# Altium schematic sheet Power.SchDoc
size A4; SheetNumber: 5; SheetTotal: 9
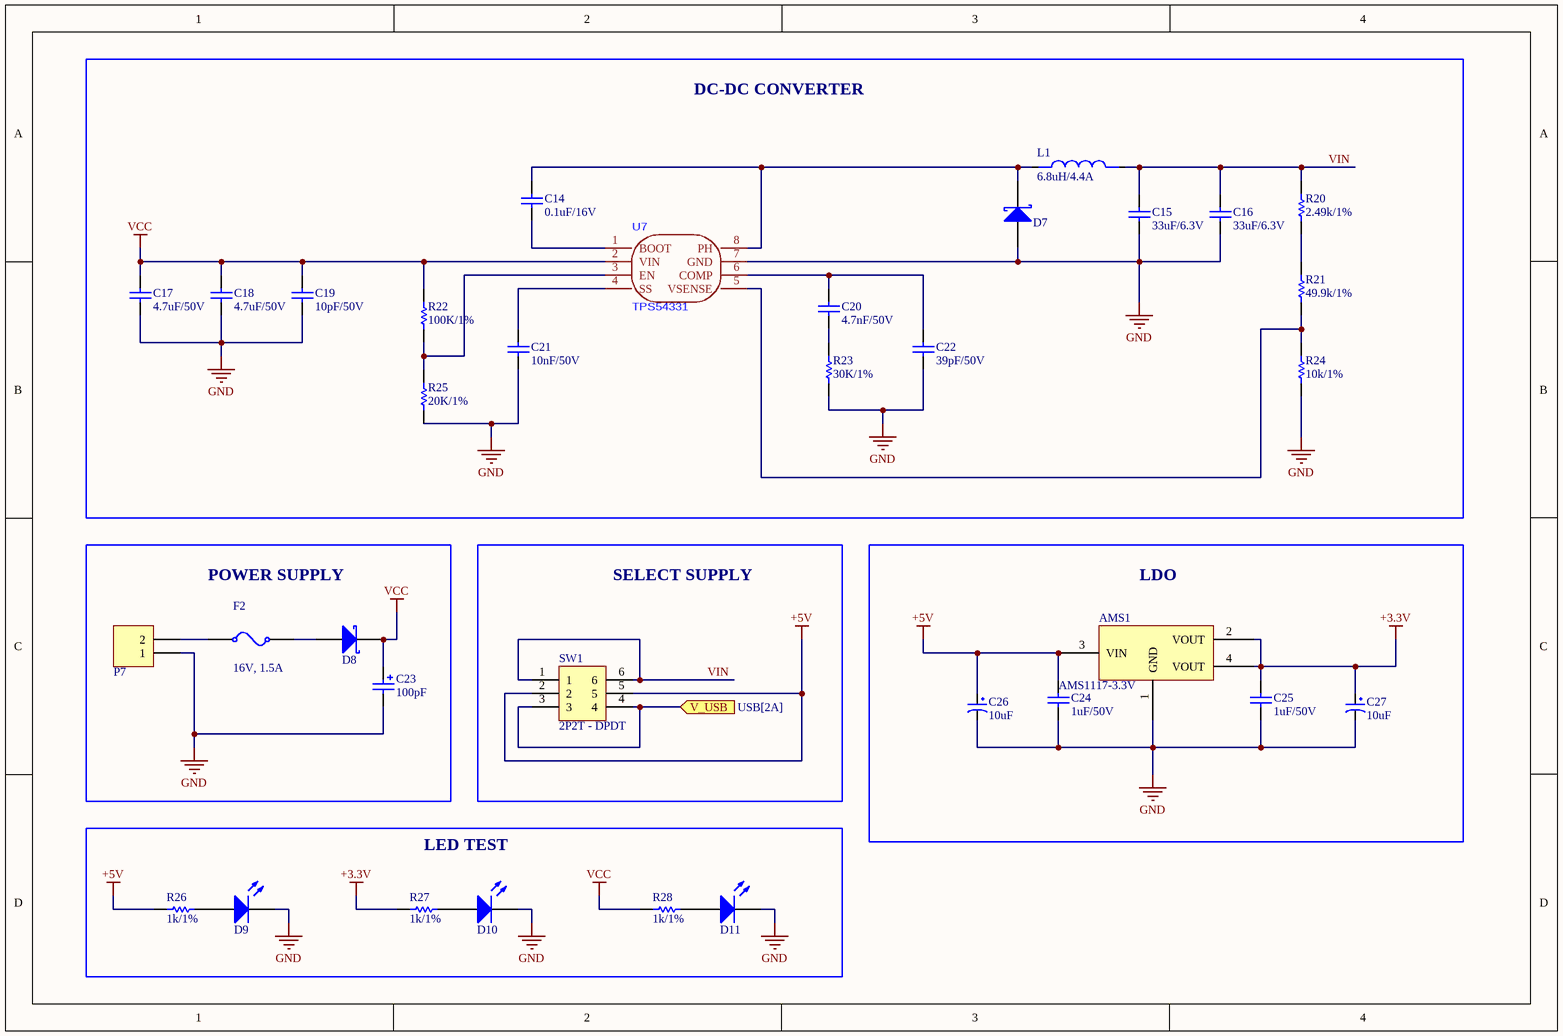
[diagram p0: Power.SchDoc]

## Parts
AMS1  AMS1117-3.3V  [SOT223]
C14  value 0.1uF/16V  [CAP-SM-0805]  (hidden comment: Cap Non-Pol SMD)
C15  value 33uF/6.3V  [CAP-SM-0805]  (hidden comment: Cap Non-Pol SMD)
C16  value 33uF/6.3V  [CAP-SM-0805]  (hidden comment: Cap Non-Pol SMD)
C17  value 4.7uF/50V  [CAP-SM-0805]  (hidden comment: Cap Non-Pol SMD)
C18  value 4.7uF/50V  [CAP-SM-0805]  (hidden comment: Cap Non-Pol SMD)
C19  value 10pF/50V  [CAP-SM-0805]  (hidden comment: Cap Non-Pol SMD)
C20  value 4.7nF/50V  [CAP-SM-0805]  (hidden comment: Cap Non-Pol SMD)
C21  value 10nF/50V  [CAP-SM-0805]  (hidden comment: Cap Non-Pol SMD)
C22  value 39pF/50V  [CAP-SM-0805]  (hidden comment: Cap Non-Pol SMD)
C23  value 100pF  [CP1/2]  (hidden comment: Cap Pol)
C24  value 1uF/50V  [CAP-SM-0805]  (hidden comment: Cap Non-Pol SMD)
C25  value 1uF/50V  [CAP-SM-0805]  (hidden comment: Cap Non-Pol SMD)
C26  10uF  [tu hoa 4mm]
C27  10uF  [tu hoa 4mm]
D7  D Schottky  [SS34]  (value not drawn)
D8  D Schottky  [SS34]  (value not drawn)
D9  LED SMD  [LED_0805_Blue]  (value not drawn)
D10  LED SMD  [LED_0805_Blue]  (value not drawn)
D11  LED SMD  [LED_0805_Blue]  (value not drawn)
F2  16V, 1.5A  [Fuse_SMD_1812]
L1  6.8uH/4.4A  [CUON CAM SMD 0530]
P7  Header 2  [JP2]  (value not drawn)
R20  value 2.49k/1%  [RES-SM-0805]  (hidden comment: RESISTOR SMD)
R21  value 49.9k/1%  [RES-SM-0805]  (hidden comment: RESISTOR SMD)
R22  value 100K/1%  [RES-SM-0805]  (hidden comment: RESISTOR SMD)
R23  value 30K/1%  [RES-SM-0805]  (hidden comment: RESISTOR SMD)
R24  value 10k/1%  [RES-SM-0805]  (hidden comment: RESISTOR SMD)
R25  value 20K/1%  [RES-SM-0805]  (hidden comment: RESISTOR SMD)
R26  value 1k/1%  [RES-SM-0805]  (hidden comment: RESISTOR SMD)
R27  value 1k/1%  [RES-SM-0805]  (hidden comment: RESISTOR SMD)
R28  value 1k/1%  [RES-SM-0805]  (hidden comment: RESISTOR SMD)
SW1  2P2T - DPDT  [SW_2P2T-DPDT_SMD]
U7  TPS54331  [SO-8 TSP5430D]

## Blocks framed on the sheet
DC-DC CONVERTER: C14-C22 D7 L1 R20-R25 U7
POWER SUPPLY: C23 D8 F2 P7
SELECT SUPPLY: SW1
LDO: AMS1 C24-C27
LED TEST: D9-D11 R26-R28

## Ports
V_USB (in, see USB[2A])

## Nets
+3.3V: AMS1.2(VOUT) AMS1.4(VOUT) C25.2 C27.1 R27.1
+5V: AMS1.3(VIN) C24.2 C26.1 R26.1 SW1.2 SW1.5
GND: AMS1.1(GND) C15.2 C16.2 C17.1 C18.1 C19.1 C21.1 C22.2 C23.2 C24.1 C25.1 C26.2 C27.2 D7.1(A) D9.2(K) D10.2(K) D11.2(K) P7.1 R23.2 R24.2 R25.2 U7.7(GND)
VCC: C17.2 C18.2 C19.2 C23.1 D8.2(K) R22.1 R28.1 U7.2(VIN)
V_USB: SW1.3 SW1.4 ; port V_USB
VIN: C15.1 C16.1 L1.2 R20.1 SW1.1 SW1.6
NetC14_1: C14.1 U7.1(BOOT)
NetC14_2: C14.2 D7.2(K) L1.1 U7.8(PH)
NetC20_1: C20.1 C22.1 U7.6(COMP)
NetC20_2: C20.2 R23.1
NetC21_2: C21.2 U7.4(SS)
NetD8_1: D8.1(A) F2.1
NetD9_1: D9.1(A) R26.2
NetD10_1: D10.1(A) R27.2
NetD11_1: D11.1(A) R28.2
NetF2_0: F2.0 P7.2
NetR20_2: R20.2 R21.1
NetR21_2: R21.2 R24.1 U7.5(VSENSE)
NetR22_2: R22.2 R25.1 U7.3(EN)

## Library data of the parts
AMS1 = AMS1117 SMD: Dán; Value: AMS1117-3.3V SOT223; Don_Vi: Con; Ma_Hang: MH000596; Ghi_Chu: *; Kieu_Chan: *; Chung_Loai: Dán
C14-C22 C24 C25 = Cap Non-Pol SMD: Capacitor
C23 = Cap Pol: Polarized Capacitor (Radial)
C26 C27 = Tu Hoa 10uF 25V 4x7: Cắm; So_Chan: 2; Ten_Linh_Kien: Tụ Hóa 10uF 25V 4x7MM; Don_Vi: Con; Ma_Hang: MH001349; Chung_Loai: Cắm; Kieu_Chan: *
D7 D8 = D Schottky: Schottky Diode; Published: 8-Jun-2000; LatestRevisionDate: 17-Jul-2002; LatestRevisionNote: Re-released for DXP Platform.; PackageReference: SMB; Publisher: Altium Limited; PackageDescription: DO-214-AA/SMB; 2 C-Bend Leads; Body 5.3 x 3.6 mm, inc. leads (LxW); Code_JEDEC: DO-214-AA
D9-D11 = LED SMD: LED
F2 = 061812150024: Resettable Fuse, Size 1812, 24V, 1.5A; Manufacturer: Littelfuse; Threshold Current: 20A; Trip Current: 3A; Threshold Voltage: 24V; Hold Current: 1.5A; Size: 1812; Mounting Technology: SMT/SMD; ComponentLink1Description: Datasheet link; ComponentLink1URL: https://www.littelfuse.com/~/media/electronics/product_specifications/resettable_ptcs/littelfuse_ptc_minismdc300f_2_product_specification.pdf.pdf; ComponentLink2Description: Supplier 1 URL; ComponentLink2URL: https://www.mouser.vn/ProductDetail/Littelfuse/MINISMDC150F-24-2?qs=F6FIpiMdEVZ%2Fp37J%2FDHAxA%3D%3D; ComponentLink3Description: Supplier 2 URL; ComponentLink3URL: https://www.digikey.com/en/products/detail/littelfuse-inc/MINISMDC150F-24-2/1113513?s=N4IgTCBcDaILIEkByCDKcAiBhAjAVgAYAxAejABYBaCAXQF8g; ComponentLink4Description: Supplier 3 URL; ComponentLink4URL: https://www.thegioiic.com/cau-chi-tu-phuc-hoi-1812-24v-1-5a; Supplier 1 Name: Mouser; Supplier 1 SN: 650-MINISMDC150F/24; Supplier 1 URL: https://www.mouser.vn/ProductDetail/Littelfuse/MINISMDC150F-24-2?qs=F6FIpiMdEVZ%2Fp37J%2FDHAxA%3D%3D; Supplier 2 Name: Digi-Key; Supplier 2 SN: MINISMDC150F24-2TR-ND; Supplier 2 URL: https://www.mouser.vn/ProductDetail/Littelfuse/MINISMDC150F-24-2?qs=F6FIpiMdEVZ%2Fp37J%2FDHAxA%3D%3D; Supplier 3 Name: thegioiic; Supplier 3 SN: N/A; Supplier 3 URL: https://www.thegioiic.com/cau-chi-tu-phuc-hoi-1812-24v-1-5a; Value: 24V, 1.5A
L1 = Cuon Cam SMD 0530: SMD 0530; MP: FDV0530-H-1R5M=P3; Package: None; Price: None; Value: *; Availability: Unavailable
P7 = Header 2: Header, 2-Pin; LatestRevisionDate: 17-Jul-2002; LatestRevisionNote: Re-released for DXP Platform.; Publisher: Altium Limited
R20-R28 = RESISTOR SMD: Resistor
SW1 = SW2_0.3A-2P2T- DPDT-SMD: PCB Mountable Slide Switch. Double Pole, Double Throw = DPDT; Manufacturer: NA; Manufacturer Part Number: NA; Supplier-1: Sunrom; Supplier Part Number-1: 5261; Case/Package: SMD; Alternate Part Number-1: NA